# EasyEDA Pro project spirala.epro

# Board PCB1
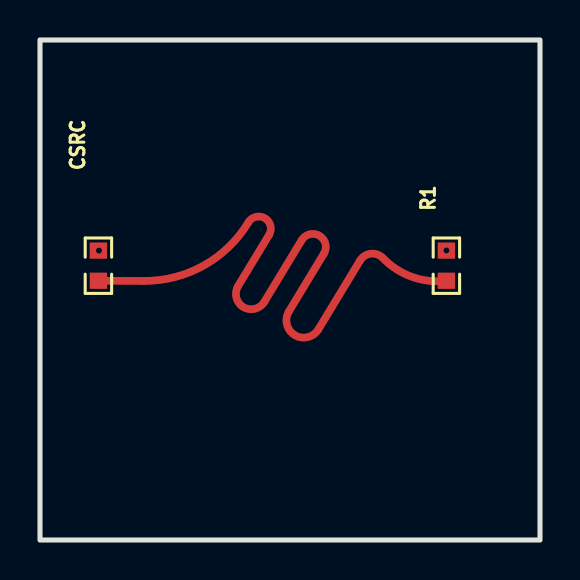
[diagram p0: board, top side]
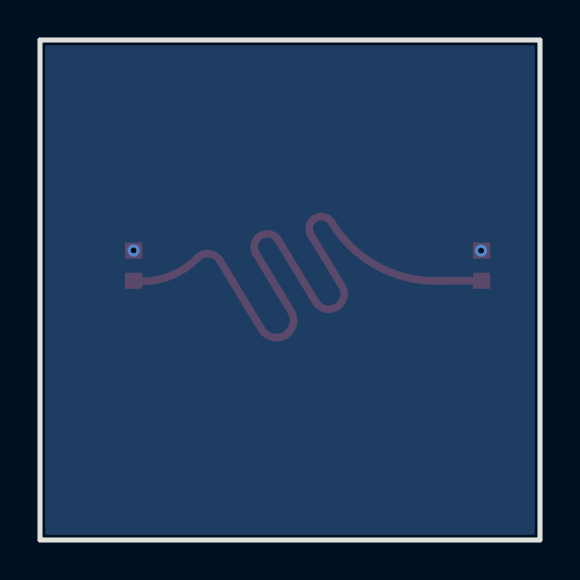
[diagram p1: board, bottom side, seen from below]

Outline 25 x 25 mm; copper layers: Top Layer, Bottom Layer. Coordinates in mm from the lower left corner of the outline.
Outline path: rectangle 0,25 25,0
Stack: Top Layer 0.035mm / Dielectric1 0.2mm FR4 er 4.5 / Bottom Layer 0.035mm

## Design rules (mm)
template: Custom Config
spacing copperThickness1oz (default): track to track 0.102, other pairs 0.152 to 0.3
spacing copperThickness2oz: track to track 0.203, other pairs 0.152 to 0.3
track width copperThickness1oz (default): min 0.127, default 0.254, max 2.54
track width copperThickness2oz: min 0.203, default 0.254, max 2.54
differential pair differentialPair (default): width min 0.127, default 0.254, max 2.54; gap min 0.152, default 0.152
via viaSize (default): diameter min 0.5, default 0.61, max 10; hole min 0.3, default 0.305, max 6.3

## Placement (name value [footprint] x y rotation side)
CSRC  0  [R0603]  2.92 13.72 90 top
R1  49.9Ω  [R0603]  20.32 13.72 90 top

## Footprints (pads in the part's own frame, mm; a bottom-side part is the same pattern mirrored in y, then rotated)
R0603
  rect 0.806x0.864 smd: 1(-0.753,0) 2(0.753,0)

## Nets
A: CSRC.1 R1.1
B: CSRC.2 R1.2

## Via types
v1: diameter 0.61, hole 0.305, Top Layer to Bottom Layer, 2 vias

## Routing (per net, layer and track width the routed paths; a pad name or vN(x,y) marks a point on that pad's centre or on a via; arc(x,y) is an arc through that point)
A: length 36.4
  Top Layer w0.38: CSRC.1 5.21,12.95 arc(8.2,13.73) 10.41,15.88 arc(11.25,16.08) 11.45,15.25 9.91,12.7 arc(10.16,11.65) 11.22,11.91 13.08,14.99 arc(13.97,15.2) 14.19,14.31 12.45,11.43 arc(12.74,10.25) 13.92,10.54 16,13.97 arc(16.54,14.32) 17.15,14.1 arc(18.6,13.16) R1.1
B: length 0
  Top Layer w0.254: CSRC.2 v1(2.95,14.47)
  vias: v1(20.32,14.48)

## Copper pours and planes (outline as drawn; the poured copper is in the pictures)
B on Bottom Layer: 0,25.02 25.02,25.02 25.02,0 0,0
